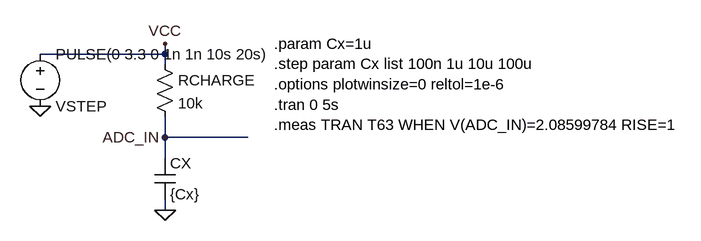
[diagram p0: schematic Capacitor_Charging_Sweep.asc]
Capacitor_Charging_Sweep.asc, the LTspice schematic file:
Version 4
SHEET 1 880 680
WIRE 160 80 352 80
WIRE 352 80 352 64
WIRE 352 96 352 64
WIRE 352 208 352 176
WIRE 352 208 480 208
WIRE 352 240 352 208
WIRE 352 320 352 304
FLAG 352 64 VCC
FLAG 352 208 ADC_IN
FLAG 352 320 0
FLAG 160 160 0
SYMBOL voltage 160 64 R0
WINDOW 0 24 96 Left 2
WINDOW 3 24 16 Left 2
SYMATTR InstName VSTEP
SYMATTR Value PULSE(0 3.3 0 1n 1n 10s 20s)
SYMBOL res 336 80 R0
SYMATTR InstName RCHARGE
SYMATTR Value 10k
SYMBOL cap 336 240 R0
SYMATTR InstName CX
SYMATTR Value {Cx}
TEXT 520 64 Left 2 !.param Cx=1u\n.step param Cx list 100n 1u 10u 100u\n.options plotwinsize=0 reltol=1e-6\n.tran 0 5s\n.meas TRAN T63 WHEN V(ADC_IN)=2.08599784 RISE=1

The netlist it stands for:
* Capacitor_Charging_Sweep.asc
VSTEP VCC 0 PULSE(0 3.3 0 1n 1n 10s 20s)
RCHARGE VCC ADC_IN 10k
CX ADC_IN 0 {Cx}
.param Cx=1u
.step param Cx list 100n 1u 10u 100u
.options plotwinsize=0 reltol=1e-6
.tran 0 5s
.meas TRAN T63 WHEN V(ADC_IN)=2.08599784 RISE=1
.backanno
.end

* Results of the author's LTspice run, read from the files saved beside the schematic
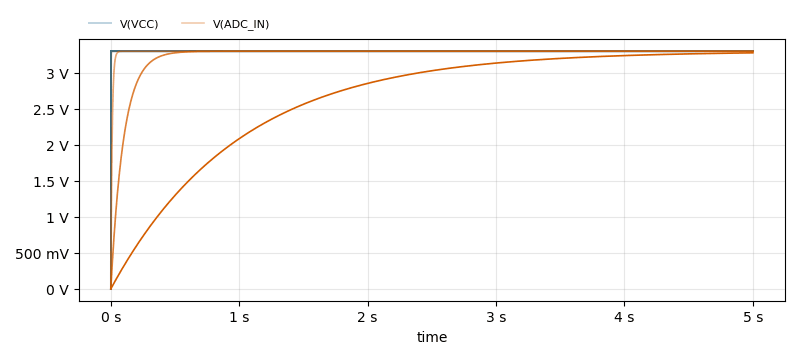
[diagram p1: Transient Analysis of Capacitor_Charging_Sweep.asc, plotted from the saved traces]
* Transient Analysis, 4 runs:
*   V(VCC) [cx=1e-07]: min 0 V, max 3.3 V, average 3.3 V, rms 3.3 V, last 3.3 V
*   V(VCC) [cx=1e-06]: min 0 V, max 3.3 V, average 3.3 V, rms 3.3 V, last 3.3 V
*   V(VCC) [cx=1e-05]: min 0 V, max 3.3 V, average 3.3 V, rms 3.3 V, last 3.3 V
*   V(VCC) [cx=0.0001]: min 0 V, max 3.3 V, average 3.3 V, rms 3.3 V, last 3.3 V
*   V(ADC_IN) [cx=1e-07]: min 0 V, max 3.3 V, average 3.299 V, rms 3.3 V, last 3.3 V
*   V(ADC_IN) [cx=1e-06]: min 0 V, max 3.3 V, average 3.293 V, rms 3.295 V, last 3.3 V
*   V(ADC_IN) [cx=1e-05]: min 0 V, max 3.3 V, average 3.234 V, rms 3.25 V, last 3.3 V
*   V(ADC_IN) [cx=0.0001]: min 0 V, max 3.278 V, average 2.644 V, rms 2.766 V, last 3.278 V
* From the log:
*   Measurement: t63
*     step  V(ADC_IN)=2.08599784
*        1  0.00100028995465
*        2  0.0100008405959
*        3  0.0999908955963
*        4  0.999998853589